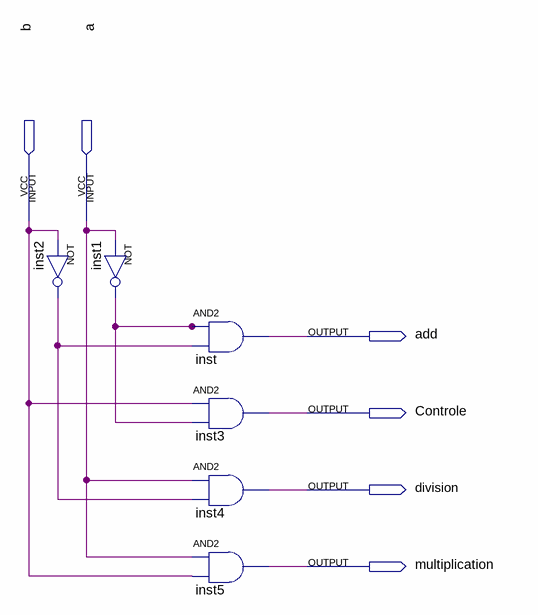
[diagram p0: schematic sheet]
// Quartus schematic arth_decoder.bdf as structural Verilog: 6 symbols, 6 pins
module arth_decoder (
  input  b,
  input  a,
  output add,
  output Controle,
  output division,
  output multiplication
);

  wire inst1_out, inst2_out;

  not inst2 (inst2_out, b);
  not inst1 (inst1_out, a);
  and inst (add, inst1_out, inst2_out);
  and inst3 (Controle, b, inst1_out);
  and inst4 (division, a, inst2_out);
  and inst5 (multiplication, a, b);
endmodule
